# Altium schematic sheet 1_SCH_Autolog.SchDoc: PROYECTO FINAL - AutoLog
size A4; Revision: V1R1; SheetNumber: 2; SheetTotal: 4
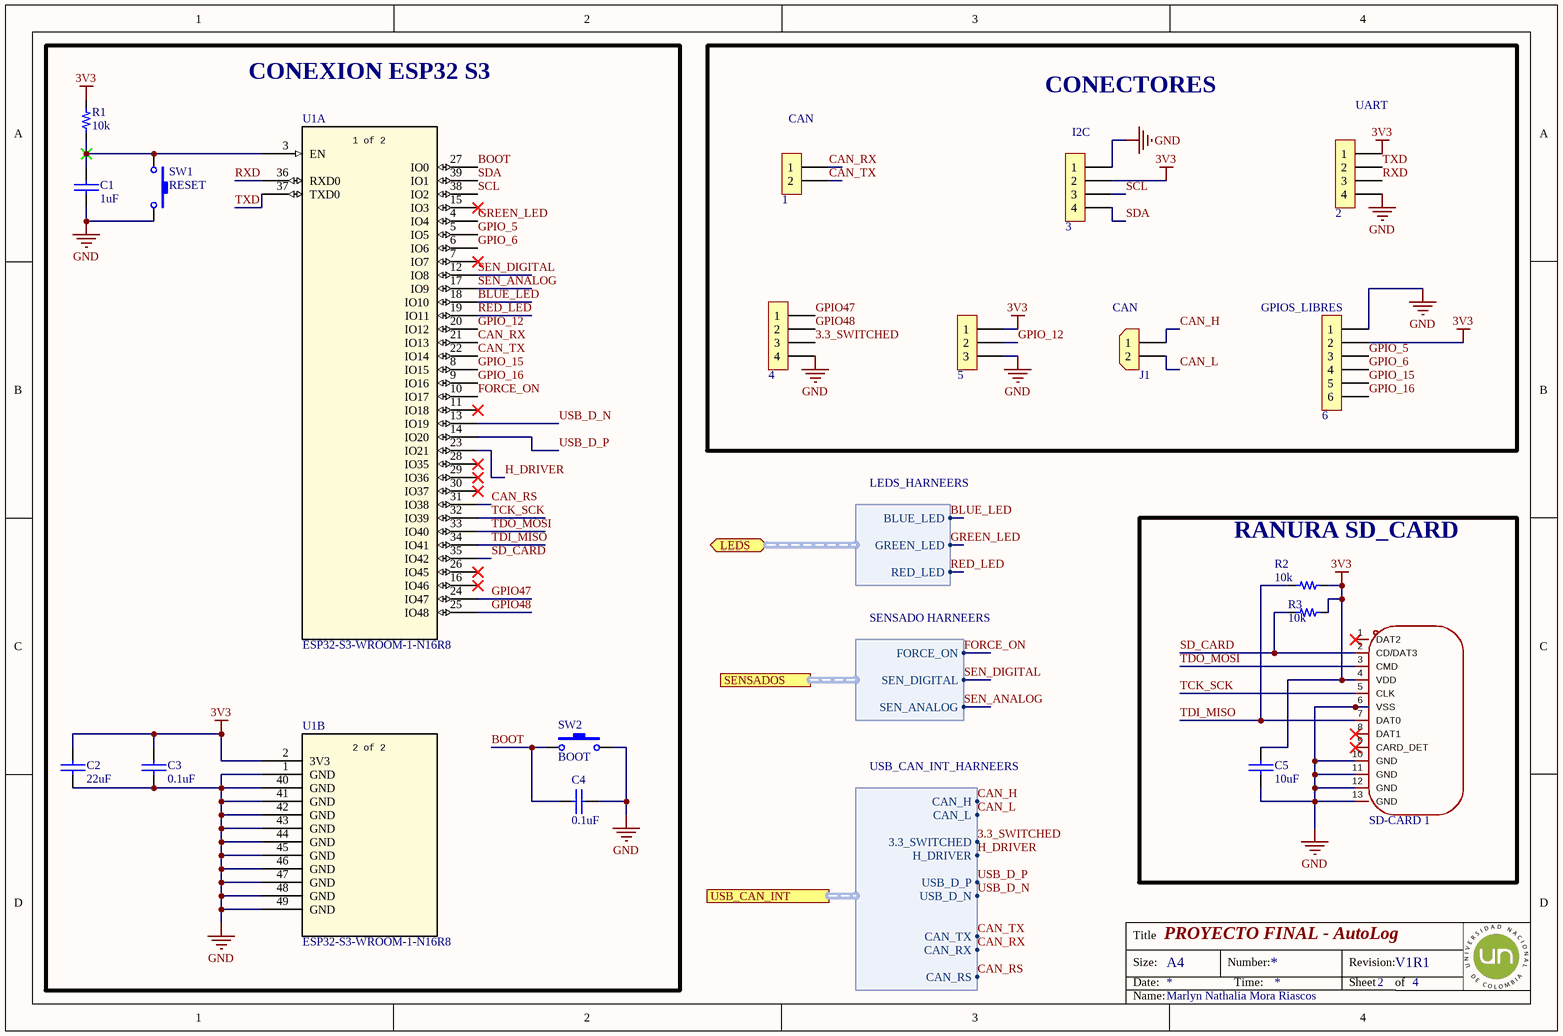
[diagram p0: 1_SCH_Autolog.SchDoc]

## Parts
1  2x1  [H_2x1_TH_100mil]  (value not drawn)  (no BOM)
2  4x1  [H_4x1_TH_2.54mm]  (value not drawn)  (no BOM)
3  4x1  [H_4x1_TH_2.54mm]  (value not drawn)  (no BOM)
4  4x1  [H_4x1_TH_2.54mm]  (value not drawn)  (no BOM)
5  3x1  [H_3X1_TH_100mil]  (value not drawn)  (no BOM)
6  6x1  [H_6x1_TH_100mil]  (value not drawn)  (no BOM)
C1  value 1uF  [0603_cap]  (hidden comment: 1uF 50V)
C2  value 22uF  [0805_cap]  (hidden comment: 22uF 16V)
C3  value 0.1uF  [0603_cap]  (hidden comment: 0.1uF 50V)
C4  value 0.1uF  [0603_cap]  (hidden comment: 0.1uF 50V)
C5  value 10uF  [0603_cap]  (hidden comment: 10uF 10V)
J1  CAN  [CON_2x1_TH_5MM]
R1  value 10k  [0603_res]  (hidden comment: 10k 1/10W)
R2  value 10k  [0603_res]  (hidden comment: 10k 1/10W)
R3  value 10k  [0603_res]  (hidden comment: 10k 1/10W)
SD-CARD_1  Micro_SD_socket  [MICROSD CARD SMD]  (value not drawn)
SW1  RESET  [Sw_PUSH_4.5x4.5x5mm]
SW2  BOOT  [Sw_PUSH_4.5x4.5x5mm]
U1  ESP32-S3-WROOM-1-N16R8  [ESP32S3WROOM1N8R2]  (parts A,B of 2)

## Blocks framed on the sheet
CONEXION ESP32 S3: C1-C4 R1 SW1 SW2 U1
CONECTORES: 1-6 J1
RANURA SD_CARD: C5 R2 R3 SD-CARD_1

## Ports
LEDS (bidir, harness LEDS_HARNEERS, see Maiin[2B], 3_SCH_Autolog[4C]), SENSADOS (harness SENSADO HARNEERS, see Maiin[2B], 3_SCH_Autolog[3A]), USB_CAN_INT (harness USB_CAN_INT_HARNEERS, see Maiin[2A], 2_SCH_Autolog[1D])

## Harnesses
LEDS_HARNEERS: RED_LED, GREEN_LED, BLUE_LED
SENSADO HARNEERS: FORCE_ON, SEN_DIGITAL, SEN_ANALOG
USB_CAN_INT_HARNEERS: USB_D_P, USB_D_N, H_DRIVER, 3.3_SWITCHED, CAN_L, CAN_TX, CAN_RX, CAN_RS, CAN_H

## Nets
3V3: 2.1 3.2 5.1 6.2 C2.1 C3.1 C5.2 R1.2 R2.2 R3.2 SD-CARD_1.4(VDD) U1.2(3V3)
GND: 2.4 3.1 4.4 5.3 6.1 C1.2 C2.2 C3.2 C4.1 C5.1 SD-CARD_1.6(VSS) SD-CARD_1.10(GND) SD-CARD_1.11(GND) SD-CARD_1.12(GND) SD-CARD_1.13(GND) SW1.2 SW2.2 U1.1(GND) U1.40(GND) U1.41(GND) U1.42(GND) U1.43(GND) U1.44(GND) U1.45(GND) U1.46(GND) U1.47(GND) U1.48(GND) U1.49(GND)
3.3_SWITCHED: 4.3 ; port USB_CAN_INT.3.3_SWITCHED
BLUE_LED: U1.18(IO10) ; port LEDS.BLUE_LED
BOOT: C4.2 SW2.1 U1.27(IO0)
CAN_H: J1.1 ; port USB_CAN_INT.CAN_H
CAN_L: J1.2 ; port USB_CAN_INT.CAN_L
CAN_RS: U1.31(IO38) ; port USB_CAN_INT.CAN_RS
CAN_RX: 1.1 U1.21(IO13) ; port USB_CAN_INT.CAN_RX
CAN_TX: 1.2 U1.22(IO14) ; port USB_CAN_INT.CAN_TX
FORCE_ON: U1.10(IO17) ; port SENSADOS.FORCE_ON
GPIO47: 4.1 U1.24(IO47)
GPIO48: 4.2 U1.25(IO48)
GPIO_5: 6.3 U1.5(IO5)
GPIO_6: 6.4 U1.6(IO6)
GPIO_12: 5.2 U1.20(IO12)
GPIO_15: 6.5 U1.8(IO15)
GPIO_16: 6.6 U1.9(IO16)
GREEN_LED: U1.4(IO4) ; port LEDS.GREEN_LED
H_DRIVER: U1.23(IO21) ; port USB_CAN_INT.H_DRIVER
RED_LED: U1.19(IO11) ; port LEDS.RED_LED
RXD: 2.3 U1.36(RXD0)
SCL: 3.3 U1.38(IO2)
SD_CARD: R3.1 SD-CARD_1.2(CD/DAT3) U1.35(IO42)
SDA: 3.4 U1.39(IO1)
SEN_ANALOG: U1.17(IO9) ; port SENSADOS.SEN_ANALOG
SEN_DIGITAL: U1.12(IO8) ; port SENSADOS.SEN_DIGITAL
TCK_SCK: SD-CARD_1.5(CLK) U1.32(IO39)
TDI_MISO: R2.1 SD-CARD_1.7(DAT0) U1.34(IO41)
TDO_MOSI: SD-CARD_1.3(CMD) U1.33(IO40)
TXD: 2.2 U1.37(TXD0)
USB_D_N: U1.13(IO19) ; port USB_CAN_INT.USB_D_N
USB_D_P: U1.14(IO20) ; port USB_CAN_INT.USB_D_P
NetC1_1: C1.1 R1.1 SW1.1 U1.3(EN)

Not connected (* = marked no-connect by the designer): SD-CARD_1 1(DAT2)* 8(DAT1)* 9(CARD_DET)*; U1 7(IO7)* 11(IO18)* 15(IO3)* 16(IO46)* 26(IO45)* 28(IO35)* 29(IO36)* 30(IO37)*

## Notes on the sheet
- (near 2) UART
- (near 1) CAN
- (near 3) I2C
- (near 6) GPIOS_LIBRES
- Title
- Size:
- Date:
- A4
- Number:
- Time:
- Revision:
- Sheet
- of
- Name:
- Marlyn Nathalia Mora Riascos
- (in symbol ESP32-S3-WROOM-1-N16R8  nnnnn, part A) 1 of 2
- (in symbol ESP32-S3-WROOM-1-N16R8  nnnnn, part B) 2 of 2

## Library data of the parts
1 = H_Male_2x1_TH_100mil: ComponentLink1Description: LCSC
2-4 = H_Male_4x1_TH_100mil: ComponentLink1Description: LCSC
5 = H_Male_3x1_TH_100mil: ComponentLink1Description: LCSC
6 = H_Male_6x1_TH_100mil: ComponentLink1Description: LCSC
C1 = Cap_1uF_0603_50V: 50V 1uF X5R ±10% 0603 Multilayer Ceramic Capacitors MLCC - SMD/SMT ROHS; Manufacturer: Samsung Electro-Mechanics; Manufacturer Part Number: CL10A105KB8NNNC; Supplier 1: LCSC; Supplier Part Number 1: C15849; ComponentLink1Description: LCSC; ComponentLink1URL: https://www.lcsc.com/product-detail/Multilayer-Ceramic-Capacitors-MLCC-SMD-SMT_Samsung-Electro-Mechanics-CL10A105KB8NNNC_C15849.html; ComponentLink2Description: Datashhet; ComponentLink2URL: https://www.lcsc.com/datasheet/C15849.pdf
C2 = Cap_22uF_0805_16V: 16V 22uF X5R ±20% 0805 Multilayer Ceramic Capacitors MLCC - SMD/SMT ROHS; Manufacturer: Chinocera; Manufacturer Part Number: HGC0805R5226M160NSLJ; Supplier 1: LCSC; Supplier Part Number 1: C33546008; ComponentLink1Description: LCSC; ComponentLink1URL: https://lcsc.com/product-detail/Multilayer-Ceramic-Capacitors-MLCC-SMD-SMT_Chinocera-HGC0805R5226M160NSLJ_C33546008.html
C3 C4 = Cap_0.1uF_0603_50V: 50V 100nF Y5V -20%~+80% 0603 Multilayer Ceramic Capacitors MLCC - SMD/SMT ROHS; Manufacturer: Walsin Tech Corp; Manufacturer Part Number: 0603F104Z500CT; Supplier 1: LCSC; Supplier Part Number 1: C83060; ComponentLink1Description: LCSC; ComponentLink1URL: https://www.lcsc.com/product-detail/Multilayer-Ceramic-Capacitors-MLCC-SMD-SMT_Walsin-Tech-Corp-0603F104Z500CT_C83060.html
  C3: ComponentLink2Description: Datasheet; ComponentLink2URL: https://www.lcsc.com/datasheet/C83060.pdf
C5 = Cap_10uF_0603_10V: 10V 10uF X5R ±10% 0603 Multilayer Ceramic Capacitors MLCC - SMD/SMT ROHS; Manufacturer: CCTC; Manufacturer Part Number: TCC0603X5R106K100CT; Supplier 1: LCSC; Supplier Part Number 1: C380314; ComponentLink1Description: LCSC; ComponentLink1URL: https://www.lcsc.com/product-detail/Multilayer-Ceramic-Capacitors-MLCC-SMD-SMT_CCTC-TCC0603X5R106K100CT_C380314.html
J1 = Con_2x1_TH_5mm: 2POS 5MM; Manufacturer: JILN; Manufacturer Part Number: JL126-50002G01; Supplier 1: LCSC; Supplier Part Number 1: C394556; ComponentLink1Description: LCSC; ComponentLink1URL: https://www.lcsc.com/product-detail/Screw-terminal_JILN-JL126-50002G01_C394556.html; ComponentLink2Description: Datasheet; ComponentLink2URL: https://www.lcsc.com/datasheet/C394556.pdf
R1-R3 = Res_10k_0603_1/10W: RES SMD 10k OHM 5% 1/10W 0603; Manufacturer: FOJAN; Manufacturer Part Number: FRC0603J103TS; ComponentLink1URL: https://www.lcsc.com/product-detail/Chip-Resistor-Surface-Mount_FOJAN-FRC0603J103TS_C2930027.html; Supplier 1: LCSC; Supplier Part Number 1: C2930027; ComponentLink1Description: LCSC; ComponentLink2Description: Datasheet; ComponentLink2URL: https://www.lcsc.com/datasheet/C2930027.pdf
SD-CARD_1 = Micro_SD_socket: CONN MICROSD CARD R/A SMD; Manufacturer: ATOM; Manufacturer Part Number: MR01A-01211; Supplier 1: LSCS; Supplier Part Number 1: C479742; ComponentLink1Description: LSCS; ComponentLink1URL: https://www.lcsc.com/product-detail/Card-Sockets-Connectors_ATOM-MR01A-01211_C479742.html; ComponentLink2Description: Datasheet; ComponentLink2URL: https://www.lcsc.com/datasheet/C479742.pdf
SW1 SW2 = Sw_PUSH_4.5x4.5x5.0xmm: SWITCH TACTILE SPST-NO 0.05A 12V; Manufacturer: BZCN; Manufacturer Part Number: TSC015A05026A; Supplier 1: LCSC; Supplier Part Number 1: C2888509; Last modified by: N-A.Potosi; Last modified date: 20190222; ComponentLink1Description: LCSC; ComponentLink1URL: https://www.lcsc.com/product-detail/Tactile-Switches_BZCN-TSC015A05026A_C2888509.html
U1 = ESP32-S3-WROOM-1-N16R8  nnnnn: ESP32-S3 Wi-Fi & Bluetooth 5 MCU module, 16MB Flash, 8MB PSRAM.; Manufacturer: Espressif Systems; Suplier  Part Number: 5407-ESP32-S3-WROOM-1-N16R8TR-ND; Manufacturer product number: ESP32-S3-WROOM-1-N16R8; ComponentLink1Description: DataSheep; ComponentLink1URL: https://documentation.espressif.com/esp32-s3-wroom-1_wroom-1u_datasheet_en.pdf; Supplier 1: Digi-Key; ComponentLink2Description: Digi-Key; ComponentLink2URL: https://www.digikey.com/en/products/detail/espressif-systems/ESP32-S3-WROOM-1-N16R8/16162642